# Altium schematic sheet Driver_Section.SchDoc
size A4; DocumentNumber: 6; SheetNumber: 6; SheetTotal: 8
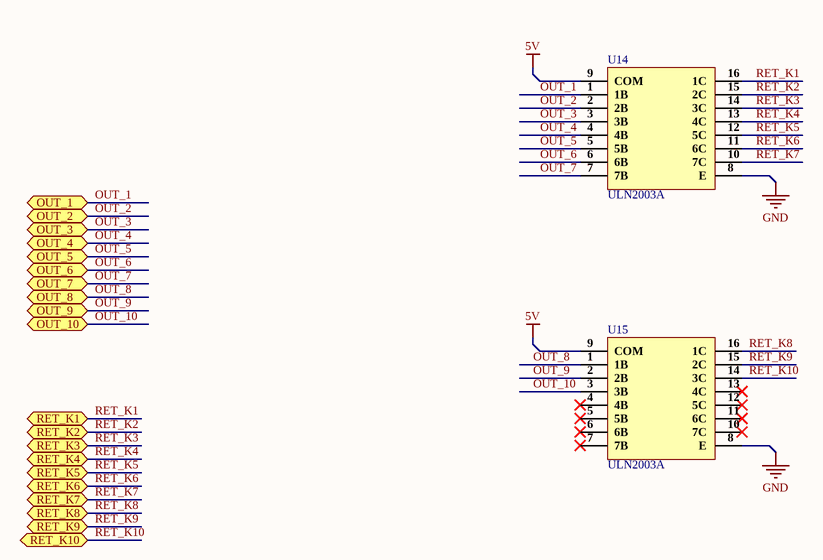
[diagram p0: Driver_Section.SchDoc]

## Parts
U14  ULN2003A  [SOP-16_150mil]
U15  ULN2003A  [SOP-16_150mil]

## Ports
OUT_1 (bidir), OUT_2 (bidir), OUT_3 (bidir), OUT_4 (bidir), OUT_5 (bidir), OUT_6 (bidir), OUT_7 (bidir), OUT_8 (bidir), OUT_9 (bidir), OUT_10 (bidir), RET_K1 (bidir), RET_K2 (bidir), RET_K3 (bidir), RET_K4 (bidir), RET_K5 (bidir), RET_K6 (bidir), RET_K7 (bidir), RET_K8 (bidir), RET_K9 (bidir), RET_K10 (bidir)

## Nets
5V: U14.9(COM) U15.9(COM)
GND: U14.8(E) U15.8(E)
OUT_1: U14.1(1B) ; port OUT_1
OUT_2: U14.2(2B) ; port OUT_2
OUT_3: U14.3(3B) ; port OUT_3
OUT_4: U14.4(4B) ; port OUT_4
OUT_5: U14.5(5B) ; port OUT_5
OUT_6: U14.6(6B) ; port OUT_6
OUT_7: U14.7(7B) ; port OUT_7
OUT_8: U15.1(1B) ; port OUT_8
OUT_9: U15.2(2B) ; port OUT_9
OUT_10: U15.3(3B) ; port OUT_10
RET_K1: U14.16(1C) ; port RET_K1
RET_K2: U14.15(2C) ; port RET_K2
RET_K3: U14.14(3C) ; port RET_K3
RET_K4: U14.13(4C) ; port RET_K4
RET_K5: U14.12(5C) ; port RET_K5
RET_K6: U14.11(6C) ; port RET_K6
RET_K7: U14.10(7C) ; port RET_K7
RET_K8: U15.16(1C) ; port RET_K8
RET_K9: U15.15(2C) ; port RET_K9
RET_K10: U15.14(3C) ; port RET_K10

Not connected (* = marked no-connect by the designer): U15 4(4B)* 5(5B)* 6(6B)* 7(7B)* 10(7C)* 11(6C)* 12(5C)* 13(4C)*

## Library data of the parts
U14 U15 = ULN2003A: 100uA@50V 3V@2V,300mA 1.6V@350mA 4mA@12V 100uA@50V 1.25V@350mA 500mA 25pF SOP-16_150mil Darlington Transistor Arrays ROHS; Manufacturer: Mixic; Item Type: IC; Manufacturer Part Number: ULN2003A; Package: SOP-16_150mil; LCSC Part Number: C181730; ComponentLink1Description: LCSC; ComponentLink1URL: https://www.lcsc.com/product-detail/Darlington-Transistor-Arrays_Mixic-ULN2003A_C181730.html